# EAGLE design ce_fdd_v40 (EAGLE 6.2)

## Sheet 1 of 3: IKBD part
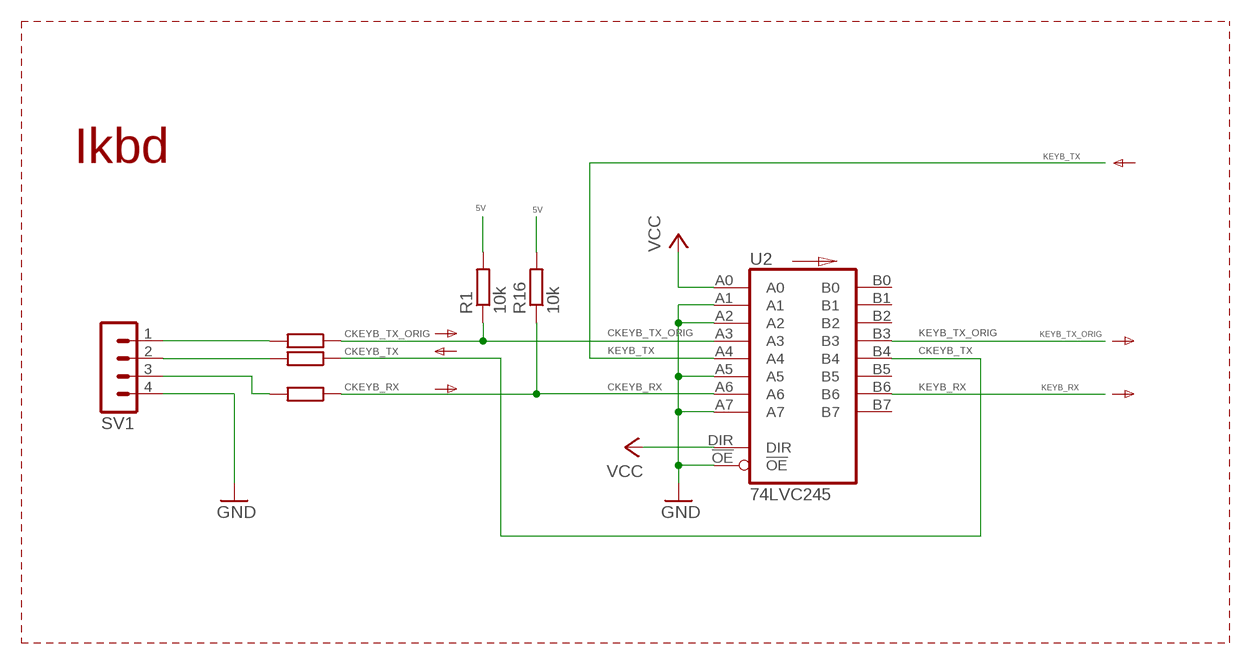
[diagram p0: schematic, sheet 1]

### Parts
R1  10k  R-EU_R0603  [R0603]
R16  10k  R-EU_R0603  [R0603]
R25  47R  R-EU_R0603  [R0603]
R33  47R  R-EU_R0603  [R0603]
R34  47R  R-EU_R0603  [R0603]
SV1  MA04-1  [MA04-1]
U2  74LVC245  [74LVC245_TSSOP20]

### Nets
5V: R1.2 R16.2 ; also sheet 3
CKEYB_RX: R16.1 R34.1 U2.A6
CKEYB_TX: R33.1 U2.B4
CKEYB_TX_ORIG: R1.1 R25.1 U2.A3
GND: SV1.4 U2.!OE U2.A1 U2.A2 U2.A5 U2.A7 ; also sheet 2,3
KEYB_RX: U2.B6 ; also sheet 3
KEYB_TX: U2.A4 ; also sheet 3
KEYB_TX_ORIG: U2.B3 ; also sheet 3
N$8: R33.2 SV1.2
VCC: U2.A0 U2.DIR ; also sheet 2,3
ZKEYB_RX: R34.2 SV1.3
ZKEYB_TX_ORIG: R25.2 SV1.1
Unconnected: U2.B0 U2.B1 U2.B2 U2.B5 U2.B7

### Notes on the sheet
- Ikbd

## Sheet 2 of 3: floppy part
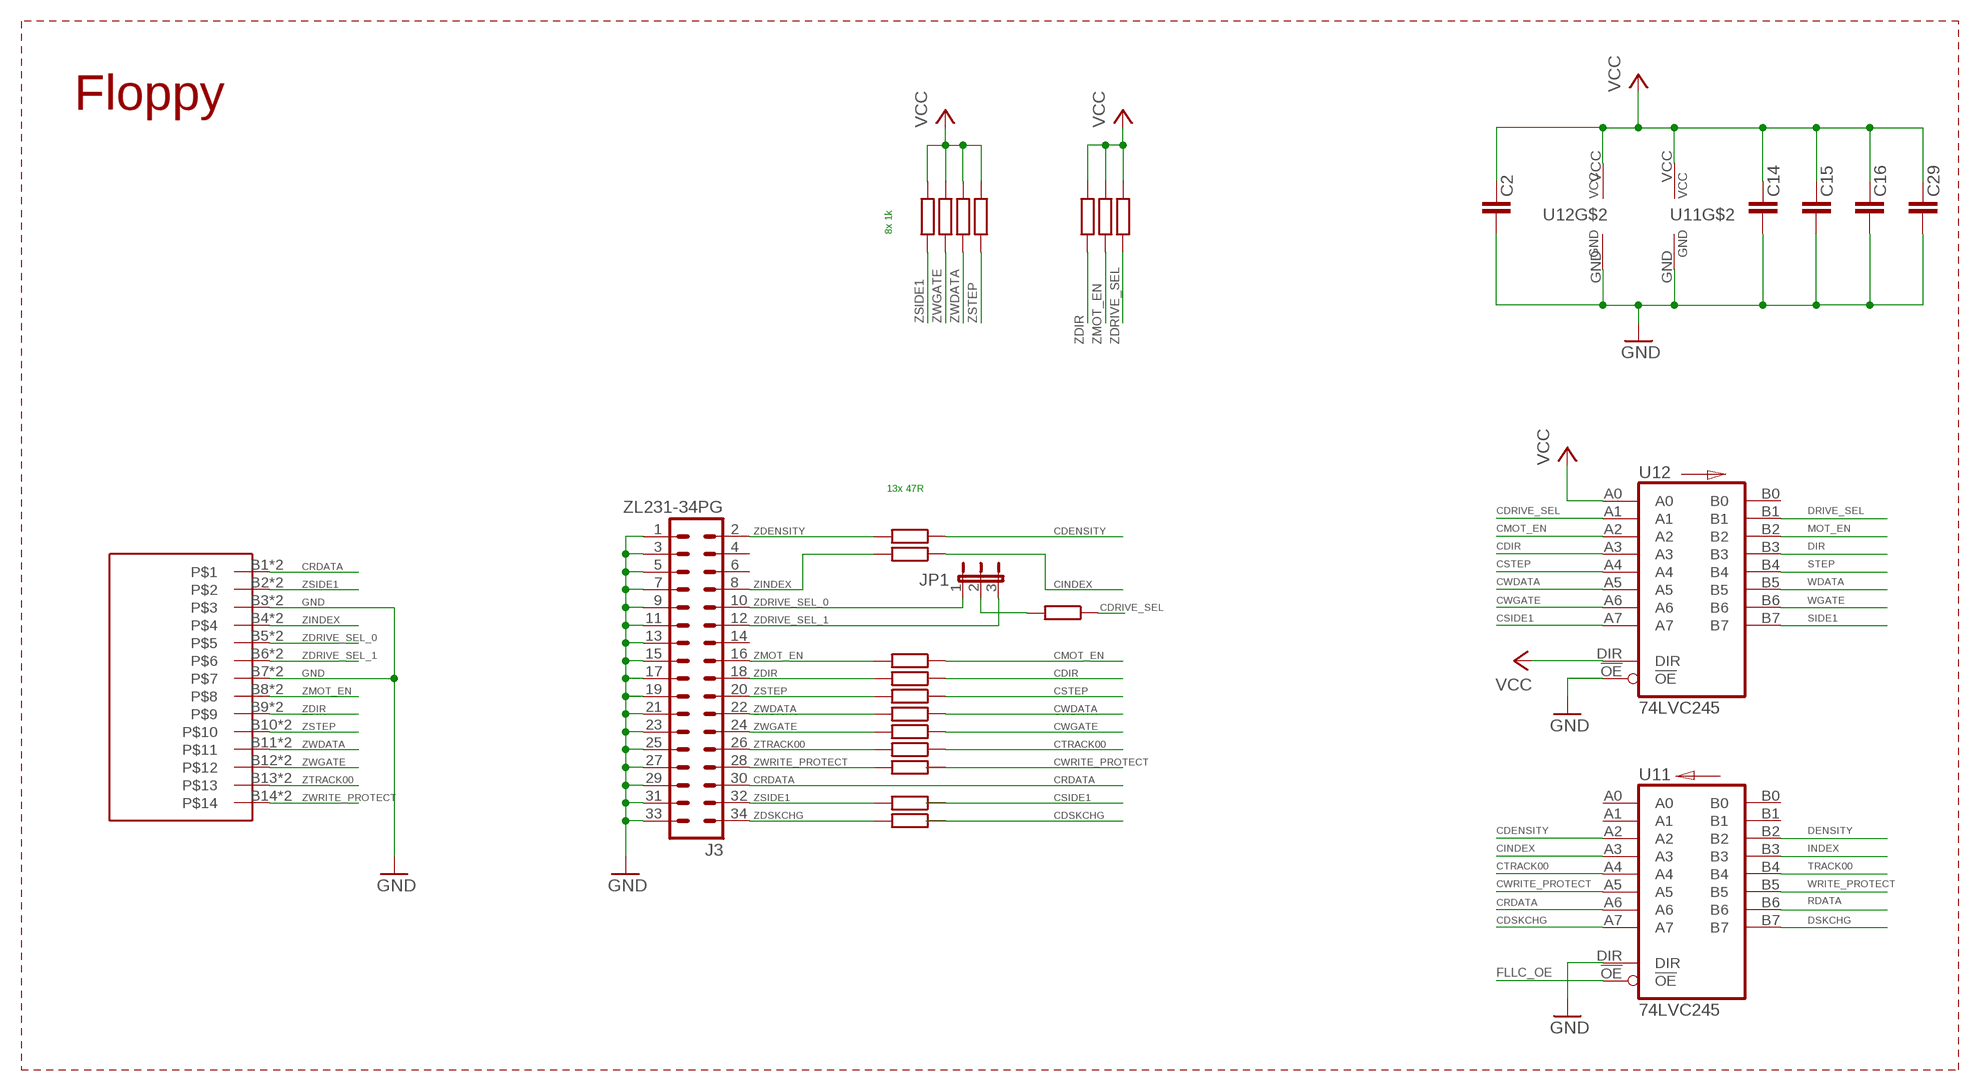
[diagram p1: schematic, sheet 2]

### Parts
C2  100 nF  C-EUC0603  [C0603]
C14  100 nF  C-EUC0603  [C0603]
C15  100 nF  C-EUC0603  [C0603]
C16  100 nF  C-EUC0603  [C0603]
C29  100 nF  C-EUC0603  [C0603]
J3  ZL231-34PG  ML34  [ML34]
JP1  JP2E  [JP2]
R2  47R  R-EU_R0603  [R0603]
R3  47R  R-EU_R0603  [R0603]
R4  47R  R-EU_R0603  [R0603]
R6  47R  R-EU_R0603  [R0603]
R7  47R  R-EU_R0603  [R0603]
R8  47R  R-EU_R0603  [R0603]
R9  47R  R-EU_R0603  [R0603]
R10  47R  R-EU_R0603  [R0603]
R11  47R  R-EU_R0603  [R0603]
R12  47R  R-EU_R0603  [R0603]
R13  47R  R-EU_R0603  [R0603]
R15  47R  R-EU_R0603  [R0603]
R22  1k  R-EU_R0603  [R0603]
R23  1k  R-EU_R0603  [R0603]
R24  1k  R-EU_R0603  [R0603]
R26  1k  R-EU_R0603  [R0603]
R27  1k  R-EU_R0603  [R0603]
R28  1k  R-EU_R0603  [R0603]
R29  1k  R-EU_R0603  [R0603]
U11  74LVC245  [74LVC245_TSSOP20]
U12  74LVC245  [74LVC245_TSSOP20]
U$1  DIN14  [DIN14]

### Nets
CDENSITY: R2.1 U11.A2
CDIR: R7.1 U12.A3
CDRIVE_SEL: R4.1 U12.A1
CDSKCHG: R15.1 U11.A7
CINDEX: R3.1 U11.A3
CMOT_EN: R6.1 U12.A2
CRDATA: J3.30 U11.A6 U$1.B1 U$1.T1
CSIDE1: R13.1 U12.A7
CSTEP: R8.1 U12.A4
CTRACK00: R11.1 U11.A4
CWDATA: R9.1 U12.A5
CWGATE: R10.1 U12.A6
CWRITE_PROTECT: R12.1 U11.A5
DENSITY: U11.B2 ; also sheet 3
DIR: U12.B3 ; also sheet 3
DRIVE_SEL: U12.B1 ; also sheet 3
DSKCHG: U11.B7 ; also sheet 3
FLLC_OE: U11.!OE ; also sheet 3
GND: C2.2 C14.2 C15.2 C16.2 C29.2 J3.1 J3.3 J3.5 J3.7 J3.9 J3.11 J3.13 J3.15 J3.17 J3.19 J3.21 J3.23 J3.25 J3.27 J3.29 J3.31 J3.33 U11.DIR U11.GND U12.!OE U12.GND U$1.B3 U$1.B7 U$1.T3 U$1.T7 ; also sheet 1,3
INDEX: U11.B3 ; also sheet 3
MOT_EN: U12.B2 ; also sheet 3
RDATA: U11.B6 ; also sheet 3
SIDE1: U12.B7 ; also sheet 3
STEP: U12.B4 ; also sheet 3
TRACK00: U11.B4 ; also sheet 3
VCC: C2.1 C14.1 C15.1 C16.1 C29.1 R22.1 R23.1 R24.1 R26.1 R27.1 R28.1 R29.1 U11.VCC U12.A0 U12.DIR U12.VCC ; also sheet 1,3
WDATA: U12.B5 ; also sheet 3
WGATE: U12.B6 ; also sheet 3
WRITE_PROTECT: U11.B5 ; also sheet 3
ZDENSITY: J3.2 R2.2
ZDIR: J3.18 R7.2 R27.2 U$1.B9 U$1.T9
ZDRIVE_SEL: JP1.2 R4.2 R29.2
ZDRIVE_SEL_0: J3.10 JP1.1 U$1.B5 U$1.T5
ZDRIVE_SEL_1: J3.12 JP1.3 U$1.B6 U$1.T6
ZDSKCHG: J3.34 R15.2
ZINDEX: J3.8 R3.2 U$1.B4 U$1.T4
ZMOT_EN: J3.16 R6.2 R28.2 U$1.B8 U$1.T8
ZSIDE1: J3.32 R13.2 R22.2 U$1.B2 U$1.T2
ZSTEP: J3.20 R8.2 R26.2 U$1.B10 U$1.T10
ZTRACK00: J3.26 R11.2 U$1.B13 U$1.T13
ZWDATA: J3.22 R9.2 R24.2 U$1.B11 U$1.T11
ZWGATE: J3.24 R10.2 R23.2 U$1.B12 U$1.T12
ZWRITE_PROTECT: J3.28 R12.2 U$1.B14 U$1.T14
Unconnected: J3.4 J3.6 J3.14 U11.A0 U11.A1 U11.B0 U11.B1 U12.B0

### Notes on the sheet
- Floppy
- 8x 1k
- 13x 47R

## Sheet 3 of 3: Front panel, power supply and RPi connection parts
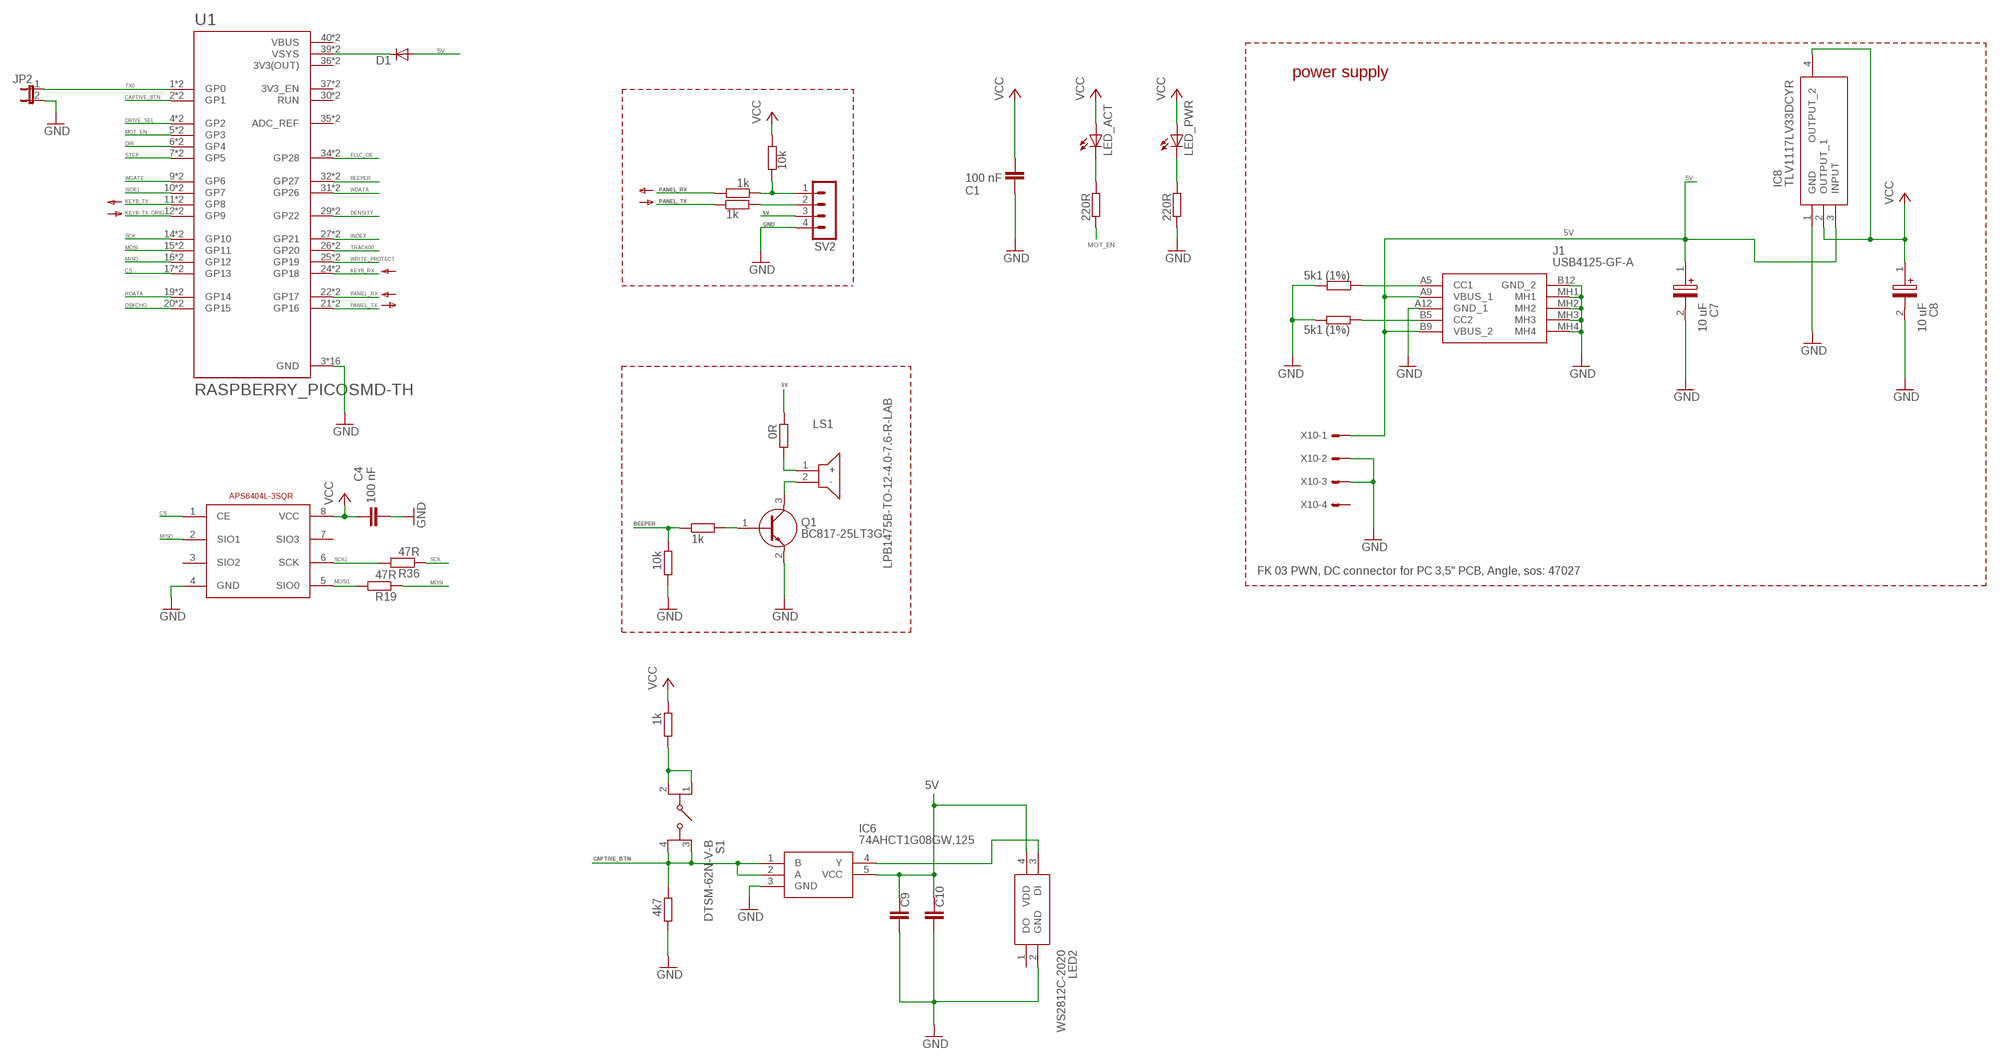
[diagram p2: schematic, sheet 3]

### Parts
C1  100 nF  C-EUC0603  [C0603]
C4  100 nF  C-EUC0603  [C0603]
C7  10 uF  293D106X9016B2TE3  [CAPPM3528X210N]
C8  10 uF  293D106X9016B2TE3  [CAPPM3528X210N]
C9  100 nF  C-EUC0603  [C0603]
C10  100 nF  C-EUC0603  [C0603]
D1  SK110-DIO  DIODE-DO214AC  [DO214AC]
IC6  74AHCT1G08GW,125  [SOT65P212X110-5N]
IC8  TLV1117LV33DCYR  [SOT230P700X180-4N]
J1  USB4125-GF-A  [USB4125GFA]
JP2  JP1E  [JP1]
LED2  WS2812C-2020  [WS2812C2020]
LED_ACT  LEDSML0603  [SML0603]
LED_PWR  LEDSML0603  [SML0603]
LS1  LPB1475B-TO-12-4.0-7.6-R-LAB  [LPB1475BTO124076RLAB]
Q1  BC817-25LT3G  [SOT96P237X111-3N]
R5  0R  R-EU_R0603  [R0603]
R14  5k1 (1%)  R-EU_R0603  [R0603]
R17  5k1 (1%)  R-EU_R0603  [R0603]
R18  220R  R-EU_R0603  [R0603]
R19  47R  R-EU_R0603  [R0603]
R20  1k  R-EU_R0603  [R0603]
R21  10k  R-EU_R0603  [R0603]
R30  1k  R-EU_R0603  [R0603]
R31  10k  R-EU_R0603  [R0603]
R32  1k  R-EU_R0603  [R0603]
R35  220R  R-EU_R0603  [R0603]
R36  47R  R-EU_R0603  [R0603]
R37  1k  R-EU_R0603  [R0603]
R38  4k7  R-EU_R0603  [R0603]
S1  DTSM-62N-V-B  [DTSM62NVB]
SV2  MA04-1  [MA04-1]
U1  RASPBERRY_PICOSMD-TH  [PICO-PKG]
U$2  APS6404L-3SQR  [SOP-8L]
X10  FK 03 PWN, DC connector for PC 3,5" PCB, Angle, sos: 47027  22-05-7048-04  [7395-04]

### Nets
5V: C7.1(+) C9.1 C10.1 D1.A IC6.5(VCC) IC8.3(INPUT) J1.A9(VBUS_1) J1.B9(VBUS_2) LED2.4(VDD) R5.1 SV2.3 X10.1 ; also sheet 1
BEEPER: R30.1 R31.1 U1.32(GP27) U1.P$32(GP27)
CAPTIVE_BTN: IC6.1(B) IC6.2(A) R38.1 S1.3(NO_1) S1.4(NO_2) U1.2(GP1) U1.P$2(GP1)
CS: U1.17(GP13) U1.P$17(GP13) U$2.1(CE)
DENSITY: U1.29(GP22) U1.P$29(GP22) ; also sheet 2
DIR: U1.6(GP4) U1.P$6(GP4) ; also sheet 2
DRIVE_SEL: U1.4(GP2) U1.P$4(GP2) ; also sheet 2
DSKCHG: U1.20(GP15) U1.P$20(GP15) ; also sheet 2
FLLC_OE: U1.34(GP28) U1.P$34(GP28) ; also sheet 2
GND: C1.2 C4.1 C7.2(-) C8.2(-) C9.2 C10.2 IC6.3(GND) IC8.1(GND) J1.A12(GND_1) J1.B12(GND_2) J1.MH1 J1.MH2 J1.MH3 J1.MH4 JP2.2 LED2.2(GND) Q1.2(E) R14.2 R17.2 R18.2 R31.2 R38.2 SV2.4 U1.3(GND) U1.8(GND) U1.13(GND) U1.18(GND) U1.23(GND) U1.28(GND) U1.33(GND) U1.38(GND) U1.P$3(GND) U1.P$8(GND) U1.P$13(GND) U1.P$18(GND) U1.P$23(GND) U1.P$28(GND) U1.P$33(GND) U1.P$38(GND) U$2.4(GND) X10.2 X10.3 ; also sheet 1,2
INDEX: U1.27(GP21) U1.P$27(GP21) ; also sheet 2
KEYB_RX: U1.24(GP18) U1.P$24(GP18) ; also sheet 1
KEYB_TX: U1.11(GP8) U1.P$11(GP8) ; also sheet 1
KEYB_TX_ORIG: U1.12(GP9) U1.P$12(GP9) ; also sheet 1
MISO: U1.16(GP12) U1.P$16(GP12) U$2.2(SIO1)
MOSI: R19.1 U1.15(GP11) U1.P$15(GP11)
MOSI1: R19.2 U$2.5(SIO0)
MOT_EN: R35.2 U1.5(GP3) U1.P$5(GP3) ; also sheet 2
N$1: J1.B5(CC2) R14.1
N$2: J1.A5(CC1) R17.1
N$3: Q1.1(B) R30.2
N$4: LS1.2(-) Q1.3(C)
N$5: LED_ACT.C R35.1
N$6: LED_PWR.C R18.1
N$7: LS1.1(+) R5.2
N$9: R21.1 R32.1 SV2.1
N$10: R37.2 SV2.2
N$13: R20.2 S1.1(COM_1) S1.2(COM_2)
N$15: IC6.4(Y) LED2.3(DI)
N$26: D1.C U1.39(VSYS) U1.P$39(VSYS)
PANEL_RX: R32.2 U1.22(GP17) U1.P$22(GP17)
PANEL_TX: R37.1 U1.21(GP16) U1.P$21(GP16)
RDATA: U1.19(GP14) U1.P$19(GP14) ; also sheet 2
SCK: R36.1 U1.14(GP10) U1.P$14(GP10)
SCK1: R36.2 U$2.6(SCK)
SIDE1: U1.10(GP7) U1.P$10(GP7) ; also sheet 2
STEP: U1.7(GP5) U1.P$7(GP5) ; also sheet 2
TRACK00: U1.26(GP20) U1.P$26(GP20) ; also sheet 2
TX0: JP2.1 U1.1(GP0) U1.P$1(GP0)
VCC: C1.1 C4.2 C8.1(+) IC8.2(OUTPUT_1) IC8.4(OUTPUT_2) LED_ACT.A LED_PWR.A R20.1 R21.2 U$2.8(VCC) ; also sheet 1,2
WDATA: U1.31(GP26) U1.P$31(GP26) ; also sheet 2
WGATE: U1.9(GP6) U1.P$9(GP6) ; also sheet 2
WRITE_PROTECT: U1.25(GP19) U1.P$25(GP19) ; also sheet 2
Unconnected: LED2.1(DO) U1.30(RUN) U1.35(ADC_REF) U1.37(3V3_EN) U1.P$30(RUN) U1.P$35(ADC_REF) U1.P$37(3V3_EN) U$2.3(SIO2) U$2.7(SIO3) X10.4

### Notes on the sheet
- power supply

## Power pins joined to a net without a drawn wire
3V3(OUT): U1.36(3V3(OUT)) U1.P$36(3V3(OUT))
GND: U2.GND
VBUS: U1.40(VBUS) U1.P$40(VBUS)
VCC: U2.VCC

## Library data of the parts
C1 C2 C4 C9 C10 C14-C16 C29 = rcl:C-EU: CAPACITOR, European symbol
C7 C8 = 293D106X9016B2TE3:293D106X9016B2TE3: Solid Tantalum Surface Mount Chip Capacitors TANTAMOUNT(TM), Molded Case, Standard Industrial Grade Source: Datasheet <http://www.vishay.com/docs/40002/293d.pdf>; DESCRIPTION: Solid Tantalum Surface Mount Chip Capacitors TANTAMOUNT(TM), Molded Case, Standard Industrial Grade; HEIGHT: 2.1mm; MANUFACTURER_NAME: Vishay; MANUFACTURER_PART_NUMBER: 293D106X9016B2TE3
D1 = diode:DIODE-: DIODE
IC6 = 74AHCT1G08GW_125:74AHCT1G08GW,125: 74AHC(T)1G08 - 2-input AND gate@en-us Source: Datasheet <https://assets.nexperia.com/documents/data-sheet/74AHC_AHCT1G08.pdf>; DESCRIPTION: 74AHC(T)1G08 - 2-input AND gate@en-us; HEIGHT: 1.1mm; MANUFACTURER_NAME: Nexperia; MANUFACTURER_PART_NUMBER: 74AHCT1G08GW,125
IC8 = TLV1117LV33DCYR:TLV1117LV33DCYR: 1-A, Positive Fixed Voltage, Low-Dropout Regulator Source: Datasheet <http://www.ti.com/lit/gpn/tlv1117lv>; DESCRIPTION: 1-A, Positive Fixed Voltage, Low-Dropout Regulator; HEIGHT: 1.8mm; MANUFACTURER_NAME: Texas Instruments; MANUFACTURER_PART_NUMBER: TLV1117LV33DCYR
J1 = USB4125-GF-A:USB4125-GF-A: USB-C (USB TYPE-C) Receptacle Connector 24 (6+18 Dummy) Position Surface Mount, Right Angle; Through Hole Source: Datasheet <https://gct.co/files/drawings/usb4125.pdf?v=f2858e04-a173-4b74-b17f-8f865ddc3728>; DESCRIPTION: USB-C (USB TYPE-C) Receptacle Connector 24 (6+18 Dummy) Position Surface Mount, Right Angle; Through Hole; HEIGHT: 3.41mm; MANUFACTURER_NAME: GCT (GLOBAL CONNECTOR TECHNOLOGY); MANUFACTURER_PART_NUMBER: USB4125-GF-A
J3 = con-harting-ml:ML34: HARTING; OC_FARNELL: unknown; OC_NEWARK: unknown
JP1 = jumper:JP2E: JUMPER
JP2 = jumper:JP1E: JUMPER
LED2 = WS2812C-2020:WS2812C-2020: Intelligent control LED integrated light source Source: Datasheet <http://www.world-semi.com/DownLoadFile/139>; DESCRIPTION: Intelligent control LED integrated light source; HEIGHT: 0.84mm; MANUFACTURER_NAME: Worldsemi; MANUFACTURER_PART_NUMBER: WS2812C-2020
LED_ACT LED_PWR = led:LED: LED OSRAM: - CHIPLED LG R971, LG N971, LY N971, LG Q971, LY Q971, LO R971, LY R971 LH N974, LH R974 LS Q976, LO Q976, LY Q976 LO Q996 - Hyper CHIPLED LW Q18S LB Q993, LB Q99A, LB R99A - SideLED LS A670, LO A670, LY A670, LG A670, LP A670 LB A673, LV A673, LT A673, LW A673 LH A674 LY A675 LS A676, LA A676, LO A676, LY A676, LW A676 LS A679, LY A679, LG A679 - Hyper Micro SIDELED® LS Y876, LA Y876, LO Y876, LY Y876 LT Y87S - SmartLED LW L88C, LW L88S LB L89C, LB L89S, LG L890 LS L89K, LO L89K, LY L89K LS L896, LA L896, LO L896, LY L896 - TOPLED LS T670, LO T670, LY T670, LG T670, LP T670 LSG T670, LSP T670, LSY T670, LOP T670, LYG T670 LG T671, LOG T671, LSG T671 LB T673, LV T673, LT T673, LW T673 LH T674 LS T676, LA T676, LO T676, LY T676, LB T676, LH T676, LSB T676, LW T676 LB T67C, LV T67C, LT T67C, LS T67K, LO T67K, LY T67K, LW E67C LS E67B, LA E67B, LO E67B, LY E67B, LB E67C, LV E67C, LT E67C LW T67C LS T679, LY T679, LG T679 LS T770, LO T770, LY T770, LG T770, LP T770 LB T773, LV T773, LT T773, LW T773 LH T774 LS E675, LA E675, LY E675, LS T675 LS T776, LA T776, LO T776, LY T776, LB T776 LHGB T686 LT T68C, LB T68C - Hyper Mini TOPLED® LB M676 - Mini TOPLED Santana® LG M470 LS M47K, LO M47K, LY M47K Source: http://www.osram.convergy.de LUXEON: - LUMILED® LXK2-PW12-R00, LXK2-PW12-S00, LXK2-PW14-U00, LXK2-PW14-V00 LXK2-PM12-R00, LXK2-PM12-S00, LXK2-PM14-U00 LXK2-PE12-Q00, LXK2-PE12-R00, LXK2-PE12-S00, LXK2-PE14-T00, LXK2-PE14-U00 LXK2-PB12-K00, LXK2-PB12-L00, LXK2-PB12-M00, LXK2-PB14-N00, LXK2-PB14-P00, LXK2-PB14-Q00 LXK2-PR12-L00, LXK2-PR12-M00, LXK2-PR14-Q00, LXK2-PR14-R00 LXK2-PD12-Q00, LXK2-PD12-R00, LXK2-PD12-S00 LXK2-PH12-R00, LXK2-PH12-S00 LXK2-PL12-P00, LXK2-PL12-Q00, LXK2-PL12-R00 Source: www.luxeon.com KINGBRIGHT: KA-3528ASYC Source: www.kingbright.com
LS1 = LPB1475B-TO-12-4.0-7.6-R-LAB:LPB1475B-TO-12-4.0-7.6-R-LAB: Sound transducer: piezo alarm; with built-in generator; THT Source: Datasheet <https://www.cre-soundbuzzer.com/datasheet/1-LPB1475B-TO-12-4.0-7.6-R.pdf>; DESCRIPTION: Sound transducer: piezo alarm; with built-in generator; THT; HEIGHT: 7.8mm; MANUFACTURER_NAME: Cre-sound Electronics; MANUFACTURER_PART_NUMBER: LPB1475B-TO-12-4.0-7.6-R-LAB
Q1 = BC817-25LT3G:BC817-25LT3G: Pb-Free Packages are Available; S Prefix for Automotive and Other Applications Requiring Unique Site and Control Change Requirements; AEC-Q101 Qualified and PPAP Capable Source: Datasheet <https://www.onsemi.com/pub/Collateral/BC817-16LT1-D.PDF>; DESCRIPTION: Pb-Free Packages are Available; S Prefix for Automotive and Other Applications Requiring Unique Site and Control Change Requirements; AEC-Q101 Qualified and PPAP Capable; HEIGHT: 1.11mm; MANUFACTURER_NAME: onsemi; MANUFACTURER_PART_NUMBER: BC817-25LT3G
R1-R38 = rcl:R-EU_: RESISTOR, European symbol
S1 = DTSM-62N-V-B:DTSM-62N-V-B: Tactile Switches TACTILE SWITCH 6X6MM Source: Datasheet <http://www.dip.com.tw/en/en-product-information/en-switch004/item/2464-dtsm-g-6>; DESCRIPTION: Tactile Switches TACTILE SWITCH 6X6MM; HEIGHT: 5.1mm; MANUFACTURER_NAME: Diptronics; MANUFACTURER_PART_NUMBER: DTSM-62N-V-B
SV1 SV2 = con-lstb:MA04-1: PIN HEADER; OC_FARNELL: unknown; OC_NEWARK: unknown
U1 = RpiPico:RASPBERRY_PICO: Raspberry Pi Pico
U2 U11 U12 = jookie:74LVC245
U$1 = floppy:DIN14
U$2 = ce_fdd_v40:APS6404L-3SQR
X10 = con-molex:22-?-04: CONNECTOR wire to board 2.54 mm (.1 inch) pitch header; OC_FARNELL: unknown; OC_NEWARK: unknown

## Board
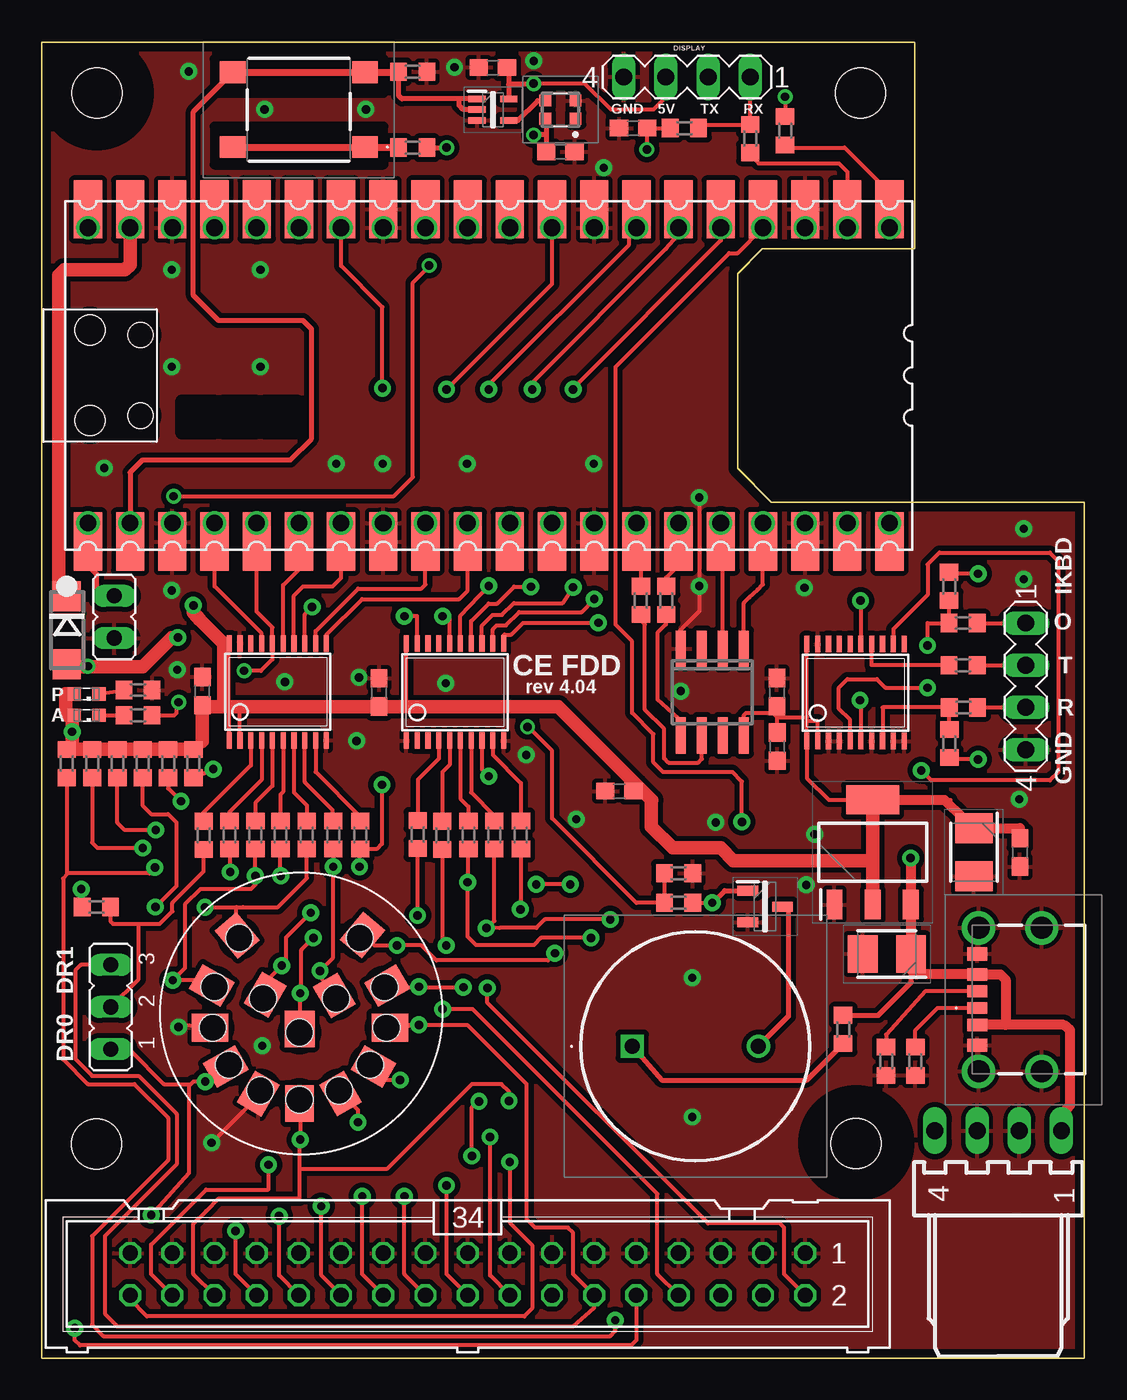
[diagram p3: board, top side]
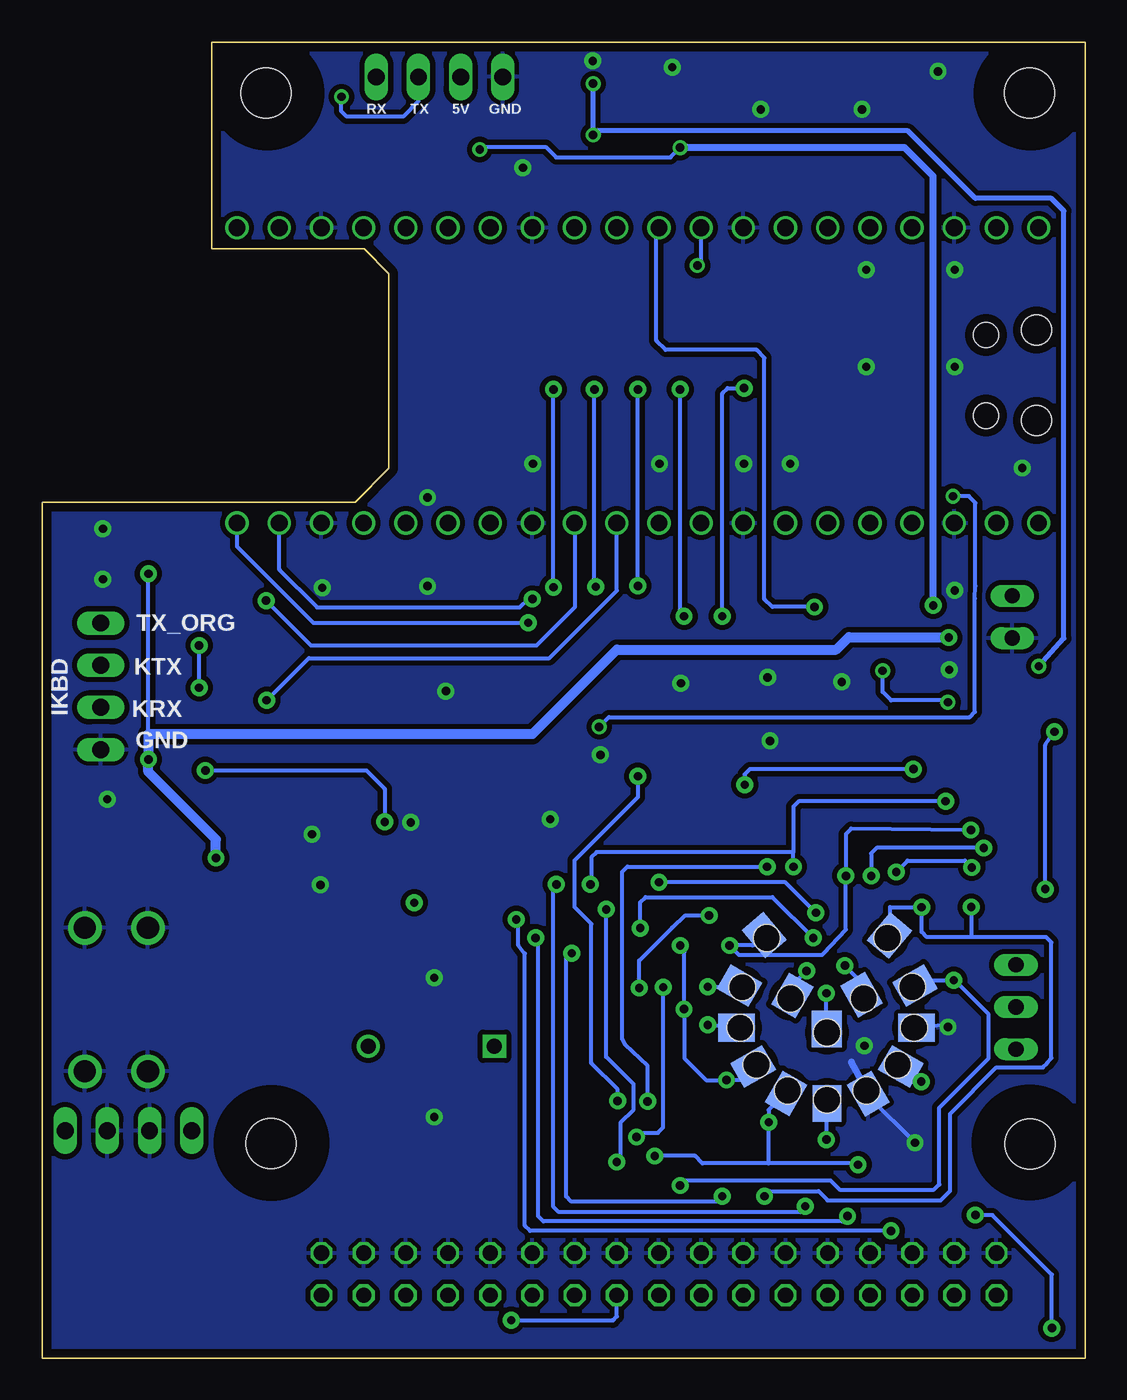
[diagram p4: board, bottom side, seen from below]

Size 62.79 x 79.25 mm. Coordinates in mm from the lower left corner, seen from the top.
Outline: 0,0 62.79,0 62.79,51.56 43.94,51.56 41.91,53.59 41.91,65.31 43.4,66.8 52.58,66.8 52.58,79.25 0,79.25 0,0
Copper layers (1*16): Top 0.035mm / dielectric 1.5mm / Bottom 0.035mm
Design rules: minimum track width 0.2mm, minimum drill 0.4mm, track to track 0.2mm, track to pad 0.2mm, pad to pad 0.2mm, via to via 0.2mm, smd to smd 0mil, copper to edge 0.5mm, drill to drill 0.5mm, minimum pad ring 0.2mm, minimum via ring 0.2mm, stop-mask expansion 4mil, vias tented up to drill 0mil, thermal gap 10mil
Holes 3 mm at 49.02,12.95 3.32,12.91 3.33,76.2 49.31,76.2
tKeepout: area 42.1,51.8 to 55.2,66.7
tRestrict: area 46,9.9 to 52.1,16; area 0.3,9.9 to 6.4,16; area 0.3,73.2 to 6.3,79.2; area 46.3,73.2 to 52.3,79.2; area 10.4,76.2 to 20.6,78.2; area 10.4,71.9 to 20.6,74.2; area 0.6,42.9 to 2.4,44.8; area 55,30.1 to 57.2,30.9; area 50.4,23.3 to 51.4,25.5
bRestrict: area 45.9,9.9 to 52,16; area 0.3,10 to 6.4,16.1; area 0.3,73.2 to 6.3,79.2; area 46.2,73.2 to 52.2,79.2

### Footprints (pad centres in the part's own frame; a part is rotated, then mirrored left to right if it is on the bottom)
C0603 = smd 1.1 x 1: 1 -0.85,0; 2 0.85,0
CAPPM3528X210N = smd 1.8 x 2.25: 1 -1.45,0; 2 1.45,0
DO214AC = smd 1.8 x 1.7: A 2.05,0; C -2.05,0
SOT65P212X110-5N = smd 1.05 x 0.4: 1 -0.95,0.65; 2 -0.95,0; 3 -0.95,-0.65; 4 0.95,-0.65; 5 0.95,0.65
SOT230P700X180-4N = smd 1.75 x 0.95: 1 -3.15,2.3; 2 -3.15,0; 3 -3.15,-2.3 | smd 1.75 x 3.2: 4 3.15,0
USB4125GFA = smd 0.7 x 1.2: A5 -0.5,2.778; B5 0.5,2.778 | smd 0.76 x 1.2: A9 1.52,2.778; B9 -1.52,2.778 | smd 0.8 x 1.2: A12 2.75,2.778; B12 -2.75,2.778 | drill 1.34 pad 2.01: MH1 4.32,2.698; MH2 4.32,-1.102; MH3 -4.32,-1.102; MH4 -4.32,2.698
ML34 = drill 0.914 octagon: 1 -20.32,-1.27; 2 -20.32,1.27; 3 -17.78,-1.27; 4 -17.78,1.27; 5 -15.24,-1.27; 6 -15.24,1.27; 7 -12.7,-1.27; 8 -12.7,1.27; 9 -10.16,-1.27; 10 -10.16,1.27; 11 -7.62,-1.27; 12 -7.62,1.27; 13 -5.08,-1.27; 14 -5.08,1.27; 15 -2.54,-1.27; 16 -2.54,1.27; 17 0,-1.27; 18 0,1.27; 19 2.54,-1.27; 20 2.54,1.27; 21 5.08,-1.27; 22 5.08,1.27; 23 7.62,-1.27; 24 7.62,1.27; 25 10.16,-1.27; 26 10.16,1.27; 27 12.7,-1.27; 28 12.7,1.27; 29 15.24,-1.27; 30 15.24,1.27; 31 17.78,-1.27; 32 17.78,1.27; 33 20.32,-1.27; 34 20.32,1.27
JP2 = drill 0.914 long: 1 -2.54,0; 2 0,0; 3 2.54,0
JP1 = drill 0.914 long: 1 0,-1.27; 2 0,1.27
WS2812C2020 = smd 0.7 x 0.7: 1 0.915,-0.55; 2 0.915,0.55; 3 -0.915,0.55; 4 -0.915,-0.55
SML0603 = smd 0.8 x 0.8: A 0.75,0; C -0.75,0
LPB1475BTO124076RLAB = drill 0.9 pad 1.4 square: 1 0,0 | drill 0.9 pad 1.4: 2 0,-7.6
SOT96P237X111-3N = smd 1.25 x 0.6: 1 -1.05,0.955; 2 -1.05,-0.955; 3 1.05,0
R0603 = smd 1 x 1.1: 1 -0.85,0; 2 0.85,0
DTSM62NVB = smd 1.55 x 1.3: 1 -3.975,2.25; 2 3.975,2.25; 3 -3.975,-2.25; 4 3.975,-2.25
MA04-1 = drill 1.016 long: 1 -3.81,0; 2 -1.27,0; 3 1.27,0; 4 3.81,0
PICO-PKG = drill 1: 1 -8.89,24.13; 2 -8.89,21.59; 3 -8.89,19.05; 4 -8.89,16.51; 5 -8.89,13.97; 6 -8.89,11.43; 7 -8.89,8.89; 8 -8.89,6.35; 9 -8.89,3.81; 10 -8.89,1.27; 11 -8.89,-1.27; 12 -8.89,-3.81; 13 -8.89,-6.35; 14 -8.89,-8.89; 15 -8.89,-11.43; 16 -8.89,-13.97; 17 -8.89,-16.51; 18 -8.89,-19.05; 19 -8.89,-21.59; 20 -8.89,-24.13; 21 8.89,-24.13; 22 8.89,-21.59; 23 8.89,-19.05; 24 8.89,-16.51; 25 8.89,-13.97; 26 8.89,-11.43; 27 8.89,-8.89; 28 8.89,-6.35; 29 8.89,-3.81; 30 8.89,-1.27; 31 8.89,1.27; 32 8.89,3.81; 33 8.89,6.35; 34 8.89,8.89; 35 8.89,11.43; 36 8.89,13.97; 37 8.89,16.51; 38 8.89,19.05; 39 8.89,21.59; 40 8.89,24.13 | smd 3.5 x 1.7: P$1 -10,24.13; P$2 -10,21.59; P$3 -10,19.05; P$4 -10,16.51; P$5 -10,13.97; P$6 -10,11.43; P$7 -10,8.89; P$8 -10,6.35; P$9 -10,3.81; P$10 -10,1.27; P$11 -10,-1.27; P$12 -10,-3.81; P$13 -10,-6.35; P$14 -10,-8.89; P$15 -10,-11.43; P$16 -10,-13.97; P$17 -10,-16.51; P$18 -10,-19.05; P$19 -10,-21.59; P$20 -10,-24.13; P$21 10,-24.13; P$22 10,-21.59; P$23 10,-19.05; P$24 10,-16.51; P$25 10,-13.97; P$26 10,-11.43; P$27 10,-8.89; P$28 10,-6.35; P$29 10,-3.81; P$30 10,-1.27; P$31 10,1.27; P$32 10,3.81; P$33 10,6.35; P$34 10,8.89; P$35 10,11.43; P$36 10,13.97; P$37 10,16.51; P$38 10,19.05; P$39 10,21.59; P$40 10,24.13 | hole 1.8: -2.725,24; 2.725,24 | hole 1.5: -2.425,20.97; 2.425,20.97
74LVC245_TSSOP20 = smd 0.305 x 0.991: !OE -2.275,2.918; A0 -2.275,-2.918; A1 -1.625,-2.918; A2 -0.975,-2.918; A3 -0.325,-2.918; A4 0.325,-2.918; A5 0.975,-2.918; A6 1.625,-2.918; A7 2.275,-2.918; B0 -1.625,2.918; B1 -0.975,2.918; B2 -0.325,2.918; B3 0.325,2.918; B4 0.975,2.918; B5 1.625,2.918; B6 2.275,2.918; B7 2.925,2.918; DIR -2.925,-2.918; GND 2.925,-2.918; VCC -2.925,2.918
DIN14 = smd 1.7 x 2.2 bottom: B1 8.5,-14.02 | smd 1.7 x 2.2 rotated 30 bottom: B2 10.97,-13.42; B12 10.59,-7.51 | smd 1.7 x 2.2 rotated 330 bottom: B3 6.02,-13.43 | smd 1.7 x 2.2 rotated 60 bottom: B4 12.95,-11.79; B9 3.21,-6.91 | smd 1.7 x 2.2 rotated 120 bottom: B5 4.06,-11.79; B8 13.78,-6.92 | smd 2.2 x 1.7 bottom: B6 13.94,-9.45; B7 3.11,-9.45 | smd 1.7 x 2.2 rotated 320 bottom: B10 12.29,-3.87 | smd 1.7 x 2.2 rotated 40 bottom: B11 4.74,-3.9 | smd 1.7 x 2.2 rotated 150 bottom: B13 6.43,-7.47 | smd 1.8 x 2.2 bottom: B14 8.51,-9.52 | smd 1.7 x 2.2: T1 8.5,-14.02 | smd 1.7 x 2.2 rotated 210: T2 10.97,-13.42 | smd 1.7 x 2.2 rotated 150: T3 6.02,-13.43; T13 6.43,-7.47 | smd 1.7 x 2.2 rotated 60: T4 12.95,-11.79; T9 3.21,-6.91 | smd 1.7 x 2.2 rotated 120: T5 4.06,-11.79; T8 13.78,-6.92 | smd 2.2 x 1.7: T6 13.94,-9.45; T7 3.11,-9.45 | smd 1.7 x 2.2 rotated 140: T10 12.29,-3.87 | smd 1.7 x 2.2 rotated 220: T11 4.74,-3.9 | smd 1.7 x 2.2 rotated 30: T12 10.59,-7.51 | smd 1.8 x 2.2: T14 8.51,-9.52 | hole 1.6: 4.87,-4.06; 3.38,-7.01; 3.27,-9.45; 4.25,-11.68; 6.13,-13.24; 8.5,-13.8; 10.87,-13.24; 12.75,-11.68; 13.73,-9.45; 13.61,-7.02; 12.13,-4.06; 10.7,-7.7; 6.3,-7.69; 8.5,-9.74
SOP-8L = smd 0.6 x 2.2: 1 -1.905,-2.6; 2 -0.635,-2.6; 3 0.635,-2.6; 4 1.905,-2.6; 5 1.905,2.6; 6 0.635,2.6; 7 -0.635,2.6; 8 -1.905,2.6
7395-04 = drill 1.016 long: 1 3.81,0; 2 1.27,0; 3 -1.27,0; 4 -3.81,0

### Placement (x,y rotation side)
C1  58.9,30.46 270 top
C2  34.78,34.16 180 top
C4  44.28,40.12 270 top
C7  50.9,24.35 180 top
C8  56.13,30.48 270 top
C9  27.18,77.72 180 top
C10  31.24,72.64 0 top
C14  9.68,40.18 90 top
C15  35.62,74.07 180 top
C16  44.29,36.83 270 top
C29  20.32,40.1 90 top
D1  1.52,43.85 270 top
IC6  27.18,75.18 0 top
IC8  50.04,30.48 90 top
J1  59.12,21.61 90 top
J3  25.65,5.08 180 top
JP1  4.16,21.16 90 top
JP2  4.38,44.64 180 top
LED2  31.24,75.18 0 top
LED_ACT  2.71,38.72 180 top
LED_PWR  2.71,40.01 180 top
LS1  35.56,18.8 90 top
Q1  43.56,27.21 0 top
R1  54.64,46.48 90 top
R2  22.65,31.54 270 top
R3  24.13,31.5 270 top
R4  9.76,31.5 270 top
R5  48.26,19.81 270 top
R6  11.32,31.51 270 top
R7  12.87,31.51 270 top
R8  14.38,31.51 270 top
R9  15.97,31.51 270 top
R10  17.56,31.51 270 top
R11  25.7,31.51 270 top
R12  27.26,31.51 270 top
R13  19.19,31.51 270 top
R14  50.85,17.89 270 top
R15  28.86,31.51 270 top
R16  54.66,37.02 270 top
R17  52.61,17.89 270 top
R18  5.81,40.24 0 top
R19  37.61,45.64 270 top
R20  22.35,72.9 180 top
R21  38.7,74.07 180 top
R22  9.14,35.81 270 top
R23  7.62,35.81 270 top
R24  6.1,35.81 270 top
R25  55.48,44.28 0 top
R26  4.57,35.81 270 top
R27  3.05,35.81 270 top
R28  1.52,35.81 270 top
R29  3.3,27.18 0 top
R30  38.35,27.43 0 top
R31  38.35,29.21 0 top
R32  42.67,73.44 270 top
R33  55.48,41.74 0 top
R34  55.5,39.2 0 top
R35  5.81,38.72 0 top
R36  36.08,45.64 270 top
R37  44.77,73.91 90 top
R38  22.35,77.47 0 top
S1  15.49,75.18 180 top
SV1  59.26,40.47 270 top
SV2  38.86,77.15 180 top
U1  26.92,59.18 90 top
U2  49.01,40.08 0 top
U11  24.89,40.12 0 top
U12  14.22,40.13 0 top
U$1  7.03,29.37 0 top
U$2  40.39,40.12 180 top
X10  57.59,13.72 0 top

### Tracks (layer width: path | path; a pad name or v marks a point on that pad's centre or on a via)
3V3(OUT)
  Top 0.254: U1.36 U1.P$36
5V  (via drill 0.5, 0.5 pad 1.02)
  Top 0.254: IC8.3 | 52.34,25.38 C7.1 | v56.39,36.07 54.76,36.07 R16.2 | v56.39,47.24 54.73,47.24 R1.2 | SV2.3 37.59,75.95 36.83,75.18 34.29,75.18 32.72,76.76 v29.62,76.76
  Top 0.305: C9.1 28.13,77.62 28.13,76.71 | 28.13,76.71 IC6.5 | LED2.4 30.39,74.57 30.39,73.67 | 30.39,73.67 C10.1 | 30.39,73.67 30.38,73.66 v29.62,73.66 | v29.62,76.76 29.57,76.71 28.13,76.71 | R5.1 50.38,20.66 52.37,22.65 52.37,23.42 | 2.54,41.66 2.54,41.89 v2.79,41.67
  Top 0.406: 52.34,23.44 C7.1
  Top 0.61: IC8.3 C7.1 | 58.04,20.09 58.04,22.81 57.72,23.13 J1.A9 52.66,23.13 52.37,23.42 52.34,23.44 | 58.04,20.09 J1.B9 | X10.1 61.42,14.65 61.93,15.24 61.93,19.77 61.53,20.09 58.04,20.09 | v52.32,30.13 52.34,29.88 IC8.3
  Top 0.813: D1.A 1.38,41.8 1.52,41.66 2.54,41.66 6.1,41.66 7.84,43.4 v8.21,43.4
  Bottom 0.254: 56.39,37.59 v56.39,47.24
  Bottom 0.305: v29.62,76.76 v29.62,73.66 29.37,73.91 10.67,73.91 6.6,69.85 2.03,69.85 1.27,69.09 1.27,43.35 v2.79,41.67
  Bottom 0.61: v52.32,30.13 52.32,31.26 56.39,35.32 v56.39,36.07 56.39,37.59 33.27,37.59 28.19,42.67 14.99,42.67 14.22,43.43 8.43,43.43 v8.21,43.4
BEEPER  (via drill 0.5)
  Top 0.254: R31.1 R30.1 35.81,27.43 30.73,32.51 30.73,36.58 29.29,38.02 v29.26,38.02 | v7.95,51.91 21.21,51.91 22.35,53.05 22.35,64.77 23.34,65.75 v23.34,65.8
  Top 0.406: U1.P$32 U1.32
  Bottom 0.254: v29.26,38.02 28.67,38.61 6.95,38.61 6.64,38.92 6.64,45.75 6.6,46.51 6.6,51.51 7,51.91 v7.95,51.91 | v23.34,65.8 23.11,66.02 U1.32
CAPTIVE_BTN
  Top 0.254: U1.P$2 U1.2
  Top 0.305: IC6.2 25.4,75.18 25.15,75.44 25.15,75.83 | IC6.1 25.15,75.83 | 25.15,75.83 21.7,75.83 21.5,76.03 R38.1 | S1.4 9.14,75.06 9.14,64.01 10.67,62.48 15.75,62.48 16.26,61.98 16.26,55.37 14.99,54.1 6.1,54.1 5.33,53.34 U1.2
  Top 0.406: S1.4 S1.3 21.47,77.43 R38.1
CDENSITY
  Top 0.254: U11.A2 23.92,36.11 22.65,34.85 R2.1
CDIR
  Top 0.254: U12.A3 13.9,34.47 12.88,33.45 R7.1
CDRIVE_SEL
  Top 0.254: U12.A1 12.6,35.71 9.76,32.88 R4.1
CDSKCHG
  Top 0.254: U11.A7 27.17,36.33 28.86,34.64 R15.1
CINDEX
  Top 0.254: U11.A3 24.57,35.74 24.13,35.31 R3.1
CKEYB_RX
  Top 0.254: U2.A6 50.63,39.2 R34.1 54.66,39.19 R16.1
CKEYB_TX
  Top 0.254: R33.1 49.98,41.73 U2.B4
CKEYB_TX_ORIG  (via drill 0.5 pad 1.02)
  Top 0.254: R1.1 R25.1 53.34,44.27 v53.34,42.93 | U2.A3 48.68,38.44 48.01,39.12 48.01,40.39 48.51,40.89 50.29,40.89 50.8,40.39 v53.34,40.39
  Bottom 0.254: v53.34,40.39 v53.34,42.93
CMOT_EN
  Top 0.254: U12.A2 13.25,34.84 11.32,32.91 R6.1
CRDATA  (via drill 0.5 pad 1.02)
  Top 0.254: U11.A6 26.52,35.46 v26.92,35.05 | J3.30 9.14,5.08 9.14,8.11 9.91,8.87 | 9.91,8.87 9.91,8.89 | 15.53,11.43 15.53,9.6 10.64,9.6 9.91,8.87 | 15.53,11.43 15.53,13.18 v15.57,13.18 15.57,15.35 U$1.T1 | v28.15,15.51 28.15,16.05 27.69,16.51 25.91,16.51 20.83,11.43 15.53,11.43
  Bottom 0.254: v26.92,35.05 26.92,33.8 30.73,29.99 30.73,27.18 29.72,26.16 29.72,17.78 28.15,16.21 v28.15,15.51 | U$1.T1 15.57,15.35 v15.57,13.18
CS
  Top 0.254: U$2.1 42.29,45.5 42.61,45.81 43.12,46.29 43.43,46.61 U1.P$17 U1.17
CSIDE1
  Top 0.254: U12.A7 16.5,35.32 19.19,32.62 R13.1
CSTEP
  Top 0.254: U12.A4 14.55,34.11 14.38,33.94 R8.1
CTRACK00
  Top 0.254: U11.A4 25.22,33.71 25.7,33.23 R11.1
CWDATA
  Top 0.254: U12.A5 15.2,34.08 15.97,33.31 R9.1
CWGATE
  Top 0.254: R10.1 17.53,33.02 15.85,34.7 U12.A6
CWRITE_PROTECT
  Top 0.254: U11.A5 25.87,34.08 27.26,32.69 R12.1
DENSITY  (via drill 0.5 pad 1.02)
  Top 0.254: U11.B2 24.57,44.69 v24.15,44.69 | U1.P$29 U1.29 30.73,64.69 v24.38,58.34
  Bottom 0.254: v24.15,44.69 24.38,44.69 | 24.54,44.69 24.38,44.69 | 24.38,44.69 v24.38,58.34
DIR
  Top 0.254: U12.B3 14.55,46.55 15.49,47.5 U1.P$6 U1.6
DRIVE_SEL
  Top 0.254: U12.B1 13.25,43.65 10.41,46.48 U1.P$4 U1.4
DSKCHG  (via drill 0.5 pad 1.02)
  Top 0.254: 27.82,42.66 U11.B7 27.82,43.52 27.88,43.58 28.27,43.58 28.99,44.29 v33.53,44.29 | U1.P$20 U1.20
  Bottom 0.254: v33.53,44.29 46.47,44.29 51.05,48.88 U1.20
FLLC_OE  (via drill 0.5 pad 1.02)
  Top 0.254: U11.!OE 22.61,44.69 v21.84,44.69 | U1.P$34 U1.34 18.03,65.79 20.53,63.29 v20.53,58.42
  Bottom 0.254: v21.84,44.69 21.84,58.1 21.53,58.42 v20.53,58.42
GND  (via drill 0.5 pad 1.02)
  Top 0.254: U$1.T3 13.02,15.77 v10.24,12.99 | U$1.T7 8.38,20.08 v8.25,19.95 | 39.62,51.99 39.62,45.01 38.43,43.81 38.43,42.7
  Bottom 0.254: U$1.T7 8.41,20.11 v8.25,19.95 | v10.24,12.99 13.02,15.77 U$1.T3 13.29,16.45
  Bottom 0.406: 13.29,16.45 14.06,17.86
  other vias: 14.65,40.74 24.34,40.66 19.11,41.01 32.19,32.46 29.18,36.34 45.93,46.4 58.86,33.67 17.75,53.86 20.54,53.86 33.24,53.86 39.59,46.5 40.59,32.27 39.59,51.83 38.48,40.18 46.55,31.56 3.78,53.61 7.84,46.24 8.18,41.47 19.53,75.2 24.86,77.74 29.64,78.12 8.86,77.49 7.84,65.55 13.18,65.55 13.18,59.71 7.84,59.71 46.04,28.51 39.18,22.92 39.18,14.54 33.85,71.69 13.29,18.83 18.97,37.18 59.13,49.96 59.13,46.91 13.43,75.2 25.62,53.86
  pour Top (isolate 0.305): 0.05,79.34 62.78,79.33 62.78,0.08 0.05,0.08
  pour Bottom (isolate 0.305): 0.05,79.34 62.78,79.33 62.78,0.08 0.04,0.08
INDEX  (via drill 0.5 pad 1.02)
  Top 0.254: U11.B3 25.22,44.73 v26.92,46.51 | v26.92,58.34 26.92,58.61 35.37,67.06 35.37,67.63 U1.27 U1.P$27
  Bottom 0.254: v26.92,46.51 v26.92,58.34
KEYB_RX  (via drill 0.5 pad 1.02)
  Top 0.254: U1.P$24 U1.24 41.91,66.55 41.4,66.55 34.54,59.69 34.54,44.2 35.56,43.18 35.56,38.86 36.83,37.59 36.83,35.89 37.4,35.32 41.58,35.32 42.16,34.73 v42.16,32.31 | v52.96,35.4 53.56,34.8 60.71,34.8 61.21,35.31 61.21,48.01 60.71,48.51 54.05,48.51 53.34,47.81 53.34,45.97 51.28,43.91 U2.B6
  Bottom 0.254: 42.24,32.7 42.16,32.62 v42.16,32.31 42.16,34.29 43.27,35.4 v52.96,35.4
KEYB_TX  (via drill 0.5 pad 1.02)
  Top 0.254: U1.11 U1.P$11 | v49.28,39.62 49.33,39.57 U2.A4
  Bottom 0.254: U1.11 28.19,46.23 32.26,42.16 46.74,42.16 v49.28,39.62
KEYB_TX_ORIG  (via drill 0.5 pad 1.02)
  Top 0.254: U1.12 U1.P$12 | v49.31,45.62 49.33,45.85 U2.B3
  Bottom 0.254: U1.12 30.73,45.21 33.02,42.93 46.61,42.93 v49.31,45.62
MISO
  Top 0.254: U$2.2 41.02,49.18 U1.P$16 U1.16
MOSI
  Top 0.254: U1.15 U1.P$15 38.35,47.75 37.61,47.01 R19.1
MOSI1
  Top 0.254: R19.2 37.59,44.77 37.59,44.2 37.08,43.69 37.08,39.69 37.34,39.45 38.32,38.54 38.35,37.59 38.48,37.72 U$2.5
MOT_EN  (via drill 0.5 pad 0.3)
  Top 0.254: v12.19,41.4 13.21,41.4 13.9,42.09 U12.B2 13.9,44.01 12.95,44.96 U1.P$5 U1.5 | R35.2 7.98,38.72 8.13,38.86 8.13,39.39 v8.25,39.51
  Bottom 0.254: v8.25,39.51 8.37,39.62 11.68,39.62 12.19,40.13 v12.19,41.4
N$1
  Top 0.254: J1.B5 53.2,22.11 50.85,19.5 R14.1
N$2
  Top 0.254: R17.1 52.61,19.77 53.94,21.11 J1.A5
N$3  (via drill 0.5 pad 1.02)
  Top 0.254: R30.2 v40.39,27.43
  Top 0.305: v40.39,27.43 41.12,28.16 Q1.1
N$4
  Top 0.305: Q1.3 44.64,27.18 44.96,27.18 44.96,20.59 LS1.2
N$5
  Top 0.254: LED_ACT.C R35.1
N$6
  Top 0.254: LED_PWR.C R18.1
N$7
  Top 0.305: LS1.1 37.34,16.76 46.06,16.76 R5.2
N$8
  Top 0.254: R33.2 SV1.2
N$9
  Top 0.254: SV2.1 R32.1 39.99,74.29 39.62,74
  Top 0.305: R21.1 39.62,74
N$10  (via drill 0.5)
  Top 0.254: v44.77,75.96 R37.2
  Bottom 0.254: SV2.2 40.13,75.69 41.06,74.76 44.45,74.76 44.77,75.08 v44.77,75.96
N$13
  Top 0.406: S1.2 S1.1 21.47,72.93 R20.2
N$15
  Top 0.305: IC6.4 28.67,74.53 29.87,75.73 LED2.3
N$26
  Top 0.813: U1.P$39 U1.39 5.33,65.85 5.02,65.53 1.37,65.53 1.05,65.22 1.05,45.91 D1.C
PANEL_RX
  Top 0.254: U1.22 U1.P$22 48.51,71.44 48.01,71.94 43.18,71.94 42.67,72.45 R32.2
PANEL_TX
  Top 0.254: U1.21 U1.P$21 50.9,70.36 48.35,72.9 44.67,72.9 44.51,73.06 R37.1
RDATA  (via drill 0.5 pad 1.02)
  Top 0.254: U11.B6 27.17,43.9 27.4,44.13 27.96,44.13 28.75,44.93 32.51,44.93 v33.27,45.72 | U1.19 U1.P$19
  Bottom 0.254: U1.19 48.51,47.5 46.23,45.21 34.04,45.21 33.53,45.72 v33.27,45.72
SCK
  Top 0.254: U1.14 U1.P$14 36.08,48.91 R36.1
SCK1
  Top 0.254: U$2.6 39.75,36.1 39.53,35.88 37.73,35.88 37.48,36.13 37.48,37.91 36.32,39.07 36.32,44.2 36.08,44.43 R36.2
SIDE1
  Top 0.254: U12.B7 17.15,43.56 19.3,45.72 25.15,45.72 25.65,46.23 U1.P$10 25.65,49.78 U1.10
STEP
  Top 0.254: U12.B4 15.2,45.93 15.75,46.48 17.53,46.48 18.03,46.99 U1.P$7 U1.7
TRACK00  (via drill 0.5 pad 1.02)
  Top 0.254: U11.B4 25.87,44.39 26.92,45.45 27.43,45.45 28.45,46.47 v29.46,46.47 | U1.P$26 U1.26 38.31,67.63 37.59,66.8 29.54,58.75 v29.54,58.34
  Bottom 0.254: v29.46,46.47 29.54,46.23 v29.54,58.34
TX0
  Top 0.254: U1.P$1 U1.1
  Top 0.305: U1.P$1 2.79,47.75 3.3,47.24 3.3,46.23 3.62,45.91 JP2.1
VBUS
  Top 0.254: U1.40 U1.P$40
VCC  (via drill 0.5, 0.5 pad 1.02)
  Top 0.254: v2.4,28.26 2.4,27.18 R29.1 | R22.1 9.68,37.17 9.68,36.83 | U12.A0 11.95,39.25 | 21.65,39.25 21.97,39.57 U11.VCC | 54.72,33.63 54.54,33.45 | U12.DIR 11.3,39.25 11.18,39.25 | 46.08,38.35 U2.DIR 46.08,34.95 47.4,33.63 49.28,33.63 | 46.08,38.35 46.08,38.61 | 46.08,38.61 U2.VCC | U2.A0 46.73,38.35 46.08,38.35 | C4.2 44.27,37.68 C16.1 44.29,38.61 | 44.29,38.61 46.08,38.61 | U$2.8 42.29,38.73 42.42,38.86 44.04,38.86 44.29,38.61 | R21.2 C15.1 36.45,74.05 v36.45,72.79
  Top 0.305: 11.05,42.94 11.25,42.94 U12.VCC | R20.1 v24.38,72.9
  Top 0.406: 39.2,30.57 39.12,30.73 | 9.14,44.93 v9.14,45.34
  Top 0.61: 49.28,33.63 IC8.4 54.36,33.63 54.54,33.45 C8.1 58.9,31.93 C1.1
  Top 0.813: R22.1 R23.1 R24.1 R26.1 R27.1 R28.1 1.44,36.66 1.68,36.67 1.84,36.83 v1.84,37.73 1.84,38.66 1.68,38.66 1.44,38.81 | 9.68,37.17 C14.1 9.68,39.25 10.97,39.25 | IC8.2 50.04,29.97 | 50.04,29.97 IC8.4 | 35.81,34.54 36.75,33.61 36.71,33.57 36.71,32.02 38,30.73 39.12,30.73 40.89,30.73 41.66,29.97 50.04,29.97 | 35.81,34.54 31.11,39.25 21.65,39.25 C29.1 11.95,39.25 11.18,39.25 10.97,39.25 | 9.14,44.93 9.54,44.45 10.97,43.02 | 10.97,43.02 11.05,42.94 | 10.97,39.25 10.97,43.02 | C2.1 35.63,34.36 35.81,34.54 | 1.44,38.81 1.44,40.01 LED_PWR.A | LED_ACT.A 1.54,38.72 1.44,38.81
  Bottom 0.254: v2.4,28.26 2.4,36.96 v1.84,37.73 | v36.45,72.79 36.29,72.95 32.48,72.95 31.84,72.31 24.97,72.31 v24.38,72.9
  Bottom 0.406: v9.14,45.34 9.14,71.18 10.86,72.9 v24.38,72.9
WDATA  (via drill 0.5 pad 1.02)
  Top 0.254: U12.B5 15.85,44.8 v16.29,45.24 | U1.P$31 U1.31
  Bottom 0.254: v16.29,45.24 18.83,45.24 19.3,45.72 19.3,60.25 19.78,60.72 25.26,60.72 25.81,61.28 25.81,67.91 U1.31
WGATE
  Top 0.254: U12.B6 16.5,43.79 19.07,46.35 22.88,46.35 23.11,46.59 U1.P$9 U1.9
WRITE_PROTECT  (via drill 0.5 pad 1.02)
  Top 0.254: U11.B5 26.52,44.12 27.16,44.77 27.72,44.77 28.43,45.48 31.37,45.48 v32,46.43 | U1.P$25 U1.25 40.89,67.31 32,58.42 v32,58.34
  Bottom 0.254: v32,46.43 v32,58.34
ZDENSITY  (via drill 0.5 pad 1.02)
  Top 0.254: J3.2 44.7,5.08 44.7,7.87 44.45,8.13 40.13,8.13 26.84,21.41 v26.84,22.3 | R2.2 22.65,26.69 v22.64,26.67
  Bottom 0.254: v26.84,22.3 26.84,23.95 24.86,25.94 24.07,26.67 22.72,26.67 22.64,26.59 v22.64,26.67
ZDIR  (via drill 0.5 pad 1.02)
  Top 0.254: R7.2 v12.88,29.05 12.88,28.53 12.61,28.26 9.56,28.26 8.64,27.34 8.64,23.5 v7.9,22.77 10.54,22.77 U$1.T9 | J3.18 24.38,5.08 v24.38,10.41 | R27.2 3.05,31.05 3.37,30.73 v6.1,30.73
  Bottom 0.254: v6.1,30.73 12.56,30.73 12.88,30.42 v12.88,29.05 | v24.38,10.41 24.08,10.72 15.34,10.72 14.78,10.16 9.1,10.16 8.78,10.48 8.78,15.1 5.84,18.03 5.84,20.77 7.85,22.77 v7.9,22.77 10.53,22.77 U$1.T9
ZDRIVE_SEL
  Top 0.254: R29.2 4.15,26.33 4.32,26.16 5.84,26.16 | 5.84,26.16 7.11,26.16 7.87,26.92 7.87,27.43 9.76,29.32 R4.2 | JP1.2 5.84,22.84 5.84,26.16
ZDRIVE_SEL_0  (via drill 0.5 pad 1.02)
  Top 0.254: JP1.1 4.24,18.54 5.33,18.54 7.37,16.51 8.98,16.51 | J3.10 35.81,1.11 35.5,0.79 2.32,0.79 2,1.11 v2,1.83 | v6.6,8.64 8.89,11.18 8.89,16.41 8.98,16.51 | 8.98,16.51 9.14,16.67 v9.86,16.67 10.95,17.76 U$1.T5
  Bottom 0.254: U$1.T5 10.94,17.75 v9.86,16.67 | v2,1.83 2,5.05 5.59,8.64 v6.6,8.64
ZDRIVE_SEL_1  (via drill 0.5 pad 1.02)
  Top 0.254: JP1.3 2.37,23.7 2.03,23.37 2.03,18.03 3.05,17.02 5.84,17.02 8.13,14.73 8.13,11.68 3.81,7.37 3.81,2.7 4.57,1.94 32,1.94 33.27,3.05 J3.12 32,5.08 32,7.56 31.69,7.87 29.72,7.87 29.21,8.38 29.21,16.51 25.66,20.06 22.72,20.07 | 22.72,20.07 20.91,20.07 22.7,20.07 v22.72,20.08 | v22.72,20.08 22.72,20.07 | U$1.T6 v22.71,20.08 v22.72,20.08
  Bottom 0.254: U$1.T6 22.72,20.07 v22.72,20.08
ZDSKCHG  (via drill 0.5 pad 1.02)
  Top 0.254: R15.2 28.86,27.21 v28.83,27.04 | v28.19,11.83 28.19,8.18 29.54,6.83 29.54,3.02 29.07,2.54 6.35,2.54 5.33,3.56 J3.34
  Bottom 0.254: v28.83,27.04 28.83,18.16 27.18,16.51 27.18,14.99 27.94,14.22 27.94,12.08 v28.19,11.83
ZINDEX  (via drill 0.5 pad 1.02)
  Top 0.254: J3.8 37.08,5.08 37.08,9.91 25.96,21.03 v24.15,21.03 | R3.2 24.13,25.26 v24.37,24.86 | v21.59,16.76 20.79,16.76 U$1.T4
  Bottom 0.254: 24.13,21.03 24.13,18.09 22.81,16.76 v21.59,16.76 20.79,16.76 U$1.T4 | v24.15,21.03 24.13,21.03 | 24.13,21.03 24.13,24.46 v24.37,24.86
ZKEYB_RX
  Top 0.254: R34.2 SV1.3
ZKEYB_TX_ORIG
  Top 0.254: R25.2 SV1.1
ZMOT_EN  (via drill 0.5 pad 1.02)
  Top 0.254: R6.2 11.32,29.29 v11.37,29.29 | J3.16 27,5 v27,13.34 | R28.2 1.52,29.21 | 1.52,29.21 1.52,29.18 1.3,28.89 1.3,18 2.79,16.51 5.59,16.51 7.62,14.48 7.62,11.94 3.05,7.37 3.05,2.03 3.73,1.35 34.23,1.35 34.54,1.67 v34.54,2.3 | v6.83,29.56 6.51,29.21 1.52,29.21 | U$1.T8 20.71,22.35 22.95,22.35 | 22.95,22.35 v25.4,22.35 | v22.72,22.38 22.95,22.35
  Bottom 0.254: v25.4,22.35 25.4,13.91 25.72,13.59 26.54,13.59 27,13.02 v27,13.34 | v34.54,2.3 28.46,2.3 28.45,2.29 28.19,2.54 J3.16 | v11.37,29.29 10.68,29.97 7.24,29.97 v6.83,29.56 | U$1.T8 20.71,22.35 22.95,22.35 v22.72,22.38
ZSIDE1  (via drill 0.5 pad 1.02)
  Top 0.254: J3.32 6.6,5.08 6.6,6.86 9.91,10.16 13.64,10.16 13.67,10.21 v13.67,11.67 | v19.14,29.61 19.14,30.61 R13.2 20.18,30.66 20.5,30.98 v20.5,34.54 | R22.2 9.15,34.97 v10.34,35.48 | v25.91,12.19 25.91,15.13 v26.34,15.48 | v19.05,14.22 19.05,14.97 18.04,15.98 18.04,16 U$1.T2
  Bottom 0.254: v19.14,29.61 27.56,29.61 27.88,29.29 27.88,19.24 27.69,18.89 26.34,17.62 v26.34,15.48 | v10.34,35.48 20.18,35.48 20.5,35.16 v20.5,34.54 | v13.67,11.67 13.67,11.75 19.05,11.75 | 19.05,11.75 23.04,11.75 23.48,12.19 v25.91,12.19 | 19.05,11.75 v19.05,14.22 19.05,14.97 U$1.T2
ZSTEP  (via drill 0.5 pad 1.02)
  Top 0.254: v14.4,29.05 14.38,29.3 R8.2 | J3.20 21.84,5.08 v21.84,9.76 | v30.91,24.4 30.48,23.97 23.77,23.97 22.88,24.88 v21.4,24.88 v21.4,24.87 20.04,24.87 U$1.T10 | v6.87,31.81 5.02,31.81 4.57,32.26 R26.2
  Bottom 0.254: v6.87,31.81 14.08,31.89 14.4,31.57 v14.4,29.05 14.4,25.81 15.75,24.38 15.84,24.29 20.83,24.29 v21.4,24.87 | v30.91,24.4 31.24,24.07 31.24,9.76 30.92,9.45 21.84,9.45 v21.84,9.76 | 19.38,24.87 v21.4,24.87 | U$1.T10 20.02,24.87 v21.4,24.87
ZTRACK00  (via drill 0.5 pad 1.02)
  Top 0.254: v16.21,26.83 14.73,25.35 14.73,23.92 v14.46,23.65 13.56,22.75 U$1.T13 | R11.2 25.7,28.72 v25.65,28.67 25.65,25.4 26.16,24.89 29.64,24.89 30.07,25.32 v33.08,25.32 | J3.26 14.3,5 v14.3,8.57
  Bottom 0.254: v33.08,25.32 32.92,25.07 32.92,8.57 32.61,8.26 14.62,8.26 v14.3,8.57 | 14.38,23.57 v14.46,23.65 13.56,22.75 U$1.T13 | v16.21,26.83 18.05,28.67 v25.65,28.67
ZWDATA  (via drill 0.5 pad 1.02)
  Top 0.254: R9.2 15.97,28.92 14.22,27.18 12.13,27.18 11.74,27.17 | J3.22 19.3,5.08 v19.3,9.76 | v9.84,27.17 11.74,27.17 | U$1.T11 11.74,27.17 | R24.2 6.1,33.27 6.6,32.77 7.62,32.77 8.13,32.26 8.13,28.45 v6.86,27.18
  Bottom 0.254: 6.86,25.37 2.35,25.37 2.03,25.05 2.03,18.08 2.08,18.03 2.29,17.78 2.54,17.53 5.33,17.53 8.13,14.73 8.13,10.1 8.7,9.53 15.49,9.53 16.05,10.08 18.99,10.08 v19.3,9.76 | v6.86,27.18 6.86,25.37 | 6.86,25.37 9.53,25.37 9.84,25.69 v9.84,27.17 11.74,27.17 U$1.T11
ZWGATE  (via drill 0.5 pad 1.02)
  Top 0.254: R10.2 v17.56,29.61 17.56,24.13 v16.76,23.34 16.76,23.03 U$1.T12 | J3.24 16.84,5 v16.84,9.16 | v31.83,28.54 v29.78,28.54 | R23.2 7.62,34.32 v8.4,33.54
  Bottom 0.254: v31.83,28.54 32,28.29 32,9.13 31.69,8.81 17.16,8.81 16.84,9.13 v16.84,9.16 | v8.4,33.54 17.24,33.54 17.56,33.23 17.56,30.48 | v17.56,29.61 17.56,30.48 | 17.56,30.48 29.4,30.48 29.72,30.16 29.72,28.54 v29.78,28.54 | U$1.T12 17.84,22.26 v16.76,23.34
ZWRITE_PROTECT  (via drill 0.5 pad 1.02)
  Top 0.254: R12.2 27.26,26.35 v26.78,25.91 27.57,25.92 29.8,25.92 30.3,26.43 v34.24,26.43 | J3.28 11.68,5.08 v11.68,7.68 | v16.37,25.32 15.64,24.6 15.64,22.06 v15.57,21.99 15.57,19.95 U$1.T14
  Bottom 0.254: v11.68,7.68 33.42,7.68 33.73,8 33.73,24.37 34.11,24.88 34.11,26.35 34.18,26.43 v34.24,26.43 | v26.78,25.91 26.78,27.46 26.46,27.78 18.83,27.78 v16.37,25.32 | U$1.T14 15.57,19.96 v15.57,21.99

### Text on the board
tNames: DISPLAY | GND | 5V | TX | RX | IKBD | O | T | CE FDD | P | rev 4.04 | R | A | GND | DR1 | DR0
bNames: GND | 5V | TX | RX | TX_ORG | KTX | IKBD | KRX | GND